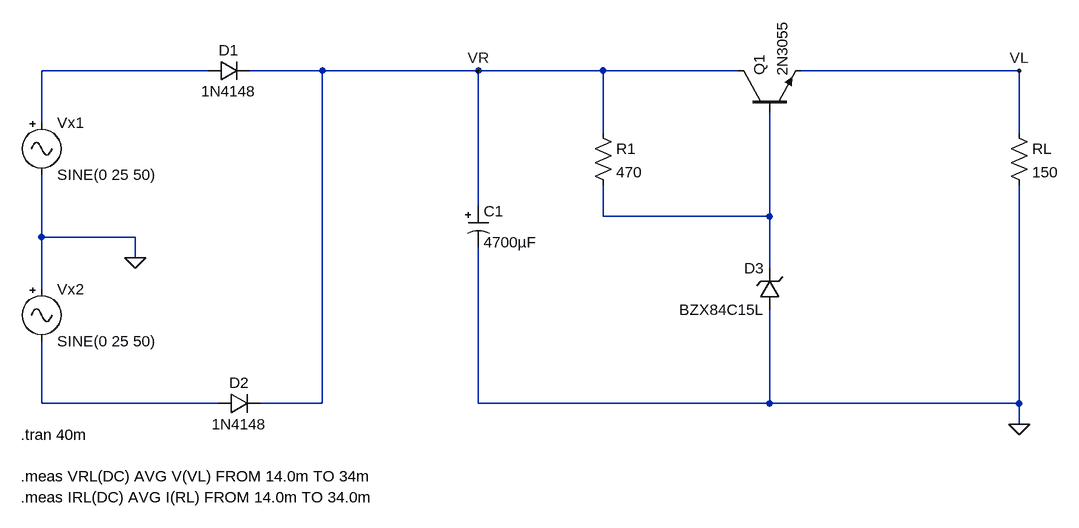
[diagram p0: schematic EXP1.5.asc]
EXP1.5.asc, the LTspice schematic file:
Version 4
SHEET 1 1636 860
WIRE 320 -16 64 -16
WIRE 496 -16 384 -16
WIRE 736 -16 496 -16
WIRE 928 -16 736 -16
WIRE 1136 -16 928 -16
WIRE 1568 -16 1232 -16
WIRE 64 64 64 -16
WIRE 928 80 928 -16
WIRE 1568 80 1568 -16
WIRE 736 192 736 -16
WIRE 928 208 928 160
WIRE 1184 208 1184 48
WIRE 1184 208 928 208
WIRE 64 240 64 144
WIRE 208 240 64 240
WIRE 208 272 208 240
WIRE 1184 288 1184 208
WIRE 64 320 64 240
WIRE 64 496 64 400
WIRE 336 496 64 496
WIRE 496 496 496 -16
WIRE 496 496 400 496
WIRE 736 496 736 256
WIRE 1184 496 1184 352
WIRE 1184 496 736 496
WIRE 1568 496 1568 160
WIRE 1568 496 1184 496
WIRE 1568 528 1568 496
FLAG 208 272 0
FLAG 1568 528 0
FLAG 1568 -16 VL
FLAG 736 -16 VR
SYMBOL Misc\\signal 64 48 R0
SYMATTR InstName Vx1
SYMATTR Value SINE(0 25 50)
SYMBOL Misc\\signal 64 304 R0
SYMATTR InstName Vx2
SYMATTR Value SINE(0 25 50)
SYMBOL diode 320 0 R270
WINDOW 0 32 32 VTop 2
WINDOW 3 0 32 VBottom 2
SYMATTR InstName D1
SYMATTR Value 1N4148
SYMBOL diode 336 512 R270
WINDOW 0 32 32 VTop 2
WINDOW 3 0 32 VBottom 2
SYMATTR InstName D2
SYMATTR Value 1N4148
SYMBOL res 1552 64 R0
SYMATTR InstName RL
SYMATTR Value 150
SYMBOL res 912 64 R0
SYMATTR InstName R1
SYMATTR Value 470
SYMBOL zener 1200 352 R180
WINDOW 0 24 64 Left 2
WINDOW 3 24 0 Left 2
SYMATTR InstName D3
SYMATTR Value BZX84C15L
SYMATTR Description Diode
SYMATTR Type diode
SYMBOL npn 1136 48 R270
SYMATTR InstName Q1
SYMATTR Value 2N3055
SYMBOL polcap 720 192 R0
SYMATTR InstName C1
SYMATTR Value 4700µF
TEXT 32 640 Left 2 !.meas IRL(DC) AVG I(RL) FROM 14.0m TO 34.0m
TEXT 32 608 Left 2 !.meas VRL(DC) AVG V(VL) FROM 14.0m TO 34m
TEXT 32 544 Left 2 !.tran 40m

The netlist it stands for:
* EXP1.5.asc
Vx1 N001 0 SINE(0 25 50)
Vx2 0 N003 SINE(0 25 50)
D1 N001 VR 1N4148
D2 N003 VR 1N4148
RL VL 0 150
R1 VR N002 470
D3 0 N002 BZX84C15L
Q1 VR N002 VL 0 2N3055
C1 VR 0 4700µF
.model D D
.lib standard.dio
.model NPN NPN
.model PNP PNP
.lib standard.bjt
.meas IRL(DC) AVG I(RL) FROM 14.0m TO 34.0m
.meas VRL(DC) AVG V(VL) FROM 14.0m TO 34m
.tran 40m
.backanno
.end